# Altium schematic sheet Sensor_Interface_SharpIR.SchDoc
size A; SheetNumber: 3; SheetTotal: 7
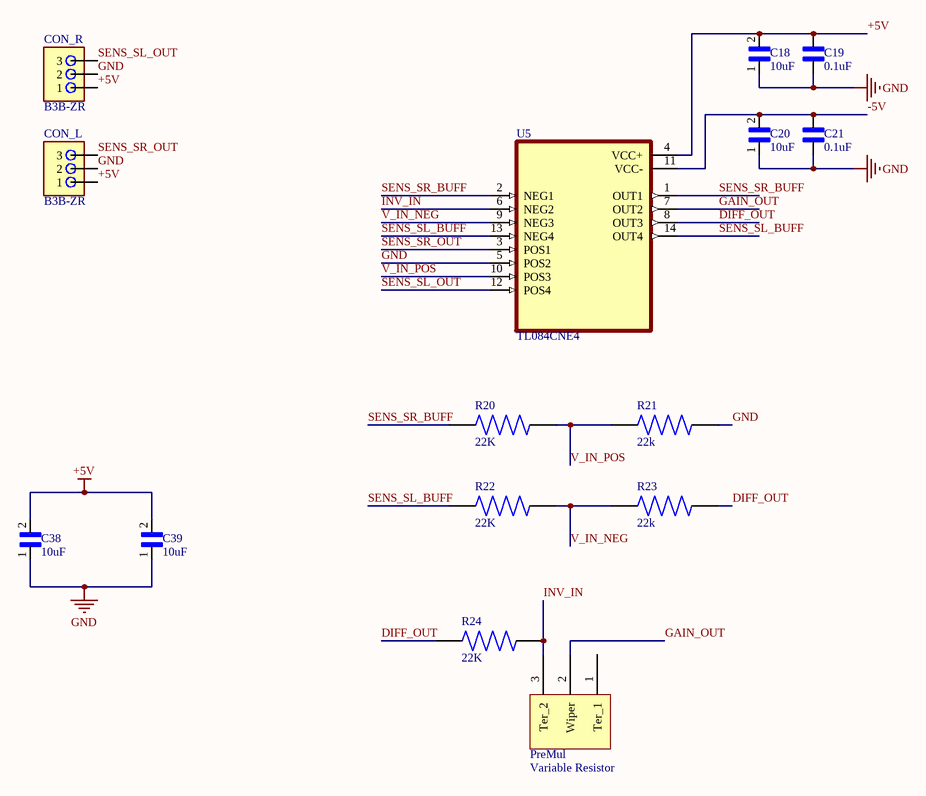
[diagram p0: Sensor_Interface_SharpIR.SchDoc]

## Parts
C18  10uF  [CAPC2012X145N]
C19  0.1uF  [CAPC2012X140N]
C20  10uF  [CAPC2012X145N]
C21  0.1uF  [CAPC2012X140N]
C38  10uF  [CAPC2012X145N]
C39  10uF  [CAPC2012X145N]
CON_L  B3B-ZR  [B3B-ZR]
CON_R  B3B-ZR  [B3B-ZR]
PreMul  Variable Resistor  [PCBComponent_1]
R20  22K  [RESC2012X65N]
R21  22k  [RESC2012X65N]
R22  22K  [RESC2012X65N]
R23  22k  [RESC2012X65N]
R24  22K  [RESC2012X65N]
U5  TL084CNE4  [SOIC127P780X200-14N]

## Nets
+5V: C18.2 C19.1 C38.2 C39.2 CON_L.1 CON_R.1 U5.4(VCC+)
GND: C18.1 C19.2 C20.1 C21.2 C38.1 C39.1 CON_L.2 CON_R.2 R21.2 U5.5(POS2)
-5V: C20.2 C21.1 U5.11(VCC-)
DIFF_OUT: R23.2 R24.1 U5.8(OUT3)
GAIN_OUT: PreMul.2(Wiper) U5.7(OUT2)
INV_IN: PreMul.3(Ter_2) R24.2 U5.6(NEG2)
SENS_SL_BUFF: R22.1 U5.13(NEG4) U5.14(OUT4)
SENS_SL_OUT: CON_R.3 U5.12(POS4)
SENS_SR_BUFF: R20.1 U5.1(OUT1) U5.2(NEG1)
SENS_SR_OUT: CON_L.3 U5.3(POS1)
V_IN_NEG: R22.2 R23.1 U5.9(NEG3)
V_IN_POS: R20.2 R21.1 U5.10(POS3)

Not connected (* = marked no-connect by the designer): PreMul 1(Ter_1)

## Library data of the parts
C18 C20 C38 C39 = C2012X6S1C106K125AC: C Series 0805 10 uF 16 V Â±10 % Tolerance X6S SMT Multilayer Ceramic Capacitor; MF: TDK; MP: C2012X6S1C106K125AC; SnapEDA_Link: https://www.snapeda.com/parts/C2012X6S1C106K125AC/TDK-Lambda+Americas+Inc/view-part/?ref=snap; Check_prices: https://www.snapeda.com/parts/C2012X6S1C106K125AC/TDK-Lambda+Americas+Inc/view-part/?ref=eda; Value: *; Purchase-URL: https://pricing.snapeda.com/search/part/C2012X6S1C106K125AC/?ref=eda; Package: 2012 TDK
C19 C21 = FS055C104K4Z2A: 0.1 ÂµF Â±10% 50V Ceramic Capacitor X7R 0805 (2012 Metric); MF: AVX; SnapEDA_Link: https://www.snapeda.com/parts/FS055C104K4Z2A/AVX/view-part/?ref=snap; Package: 0805-2 AVX; Value: *; MP: FS055C104K4Z2A; Check_prices: https://www.snapeda.com/parts/FS055C104K4Z2A/AVX/view-part/?ref=eda
CON_L CON_R = B3B-ZR: Connector Header Surface Mount 3 position 0.059 (1.50mm); MF: JST Sales; SnapEDA_Link: https://www.snapeda.com/parts/B3B-ZR/JST+Sales+America+Inc./view-part/?ref=snap; Package: None; Value: *; MP: B3B-ZR; Check_prices: https://www.snapeda.com/parts/B3B-ZR/JST+Sales+America+Inc./view-part/?ref=eda
R20-R24 = CRGCQ0805F22K: Fixed Resistor CRGCQ 0805 22K 1%; MF: TE Connectivity; SnapEDA_Link: https://www.snapeda.com/parts/CRGCQ0805F22K/TE+Connectivity/view-part/?ref=snap; Package: 2012 TE Connectivity; Value: *; MP: CRGCQ0805F22K; Check_prices: https://www.snapeda.com/parts/CRGCQ0805F22K/TE+Connectivity/view-part/?ref=eda
U5 = TL084CNE4: Quad High Slew Rate JFET-Input Operational Amplifier 14-PDIP 0 to 70; MF: Texas Instruments; SnapEDA_Link: https://www.snapeda.com/parts/TL084CNE4/Texas+Instruments/view-part/?ref=snap; Package: PDIP-14 Texas Instruments; Value: *; MP: TL084CNE4; Check_prices: https://www.snapeda.com/parts/TL084CNE4/Texas+Instruments/view-part/?ref=eda